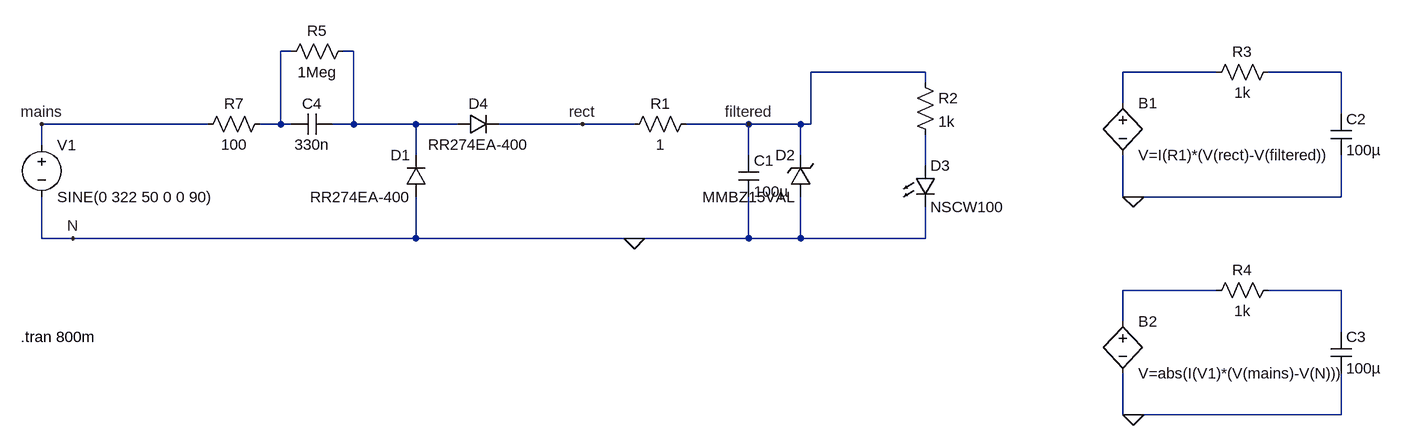
[diagram p0: schematic led_indicator_230v_capacitive.asc]
led_indicator_230v_capacitive.asc, the LTspice schematic file:
Version 4
SHEET 1 1312 680
WIRE -368 -16 -384 -16
WIRE -272 -16 -288 -16
WIRE 608 16 432 16
WIRE 1056 16 912 16
WIRE 1248 16 1136 16
WIRE 608 32 608 16
WIRE 912 64 912 16
WIRE 1248 80 1248 16
WIRE -496 96 -752 96
WIRE -384 96 -384 -16
WIRE -384 96 -416 96
WIRE -368 96 -384 96
WIRE -272 96 -272 -16
WIRE -272 96 -304 96
WIRE -176 96 -272 96
WIRE -112 96 -176 96
WIRE 80 96 -48 96
WIRE 160 96 80 96
WIRE 336 96 240 96
WIRE 416 96 336 96
WIRE 432 96 432 16
WIRE 432 96 416 96
WIRE -752 128 -752 96
WIRE -176 144 -176 96
WIRE 336 144 336 96
WIRE 416 144 416 96
WIRE 608 160 608 112
WIRE 912 208 912 144
WIRE 928 208 912 208
WIRE 1248 208 1248 144
WIRE 1248 208 928 208
WIRE -752 272 -752 208
WIRE -704 272 -752 272
WIRE -176 272 -176 208
WIRE -176 272 -704 272
WIRE 160 272 -176 272
WIRE 336 272 336 208
WIRE 336 272 160 272
WIRE 416 272 416 208
WIRE 416 272 336 272
WIRE 608 272 608 224
WIRE 608 272 416 272
WIRE 1056 352 912 352
WIRE 1248 352 1136 352
WIRE 912 400 912 352
WIRE 1248 416 1248 352
WIRE 912 544 912 480
WIRE 928 544 912 544
WIRE 1248 544 1248 480
WIRE 1248 544 928 544
FLAG 160 272 0
FLAG 928 208 0
FLAG -752 96 mains
FLAG 336 96 filtered
FLAG 928 544 0
FLAG -704 272 N
FLAG 80 96 rect
SYMBOL cap 320 144 R0
SYMATTR InstName C1
SYMATTR Value 100µ
SYMBOL LED 592 160 R0
SYMATTR InstName D3
SYMATTR Value NSCW100
SYMBOL voltage -752 112 R0
WINDOW 123 0 0 Left 2
WINDOW 39 0 0 Left 2
SYMATTR InstName V1
SYMATTR Value SINE(0 322 50 0 0 90)
SYMBOL res 592 16 R0
SYMATTR InstName R2
SYMATTR Value 1k
SYMBOL zener 432 208 R180
WINDOW 0 24 64 Left 2
WINDOW 3 24 0 Left 2
SYMATTR InstName D2
SYMATTR Value MMBZ15VAL
SYMBOL bv 912 48 R0
SYMATTR InstName B1
SYMATTR Value V=I(R1)*(V(rect)-V(filtered))
SYMBOL res 1152 0 R90
WINDOW 0 0 56 VBottom 2
WINDOW 3 32 56 VTop 2
SYMATTR InstName R3
SYMATTR Value 1k
SYMBOL cap 1232 80 R0
SYMATTR InstName C2
SYMATTR Value 100µ
SYMBOL bv 912 384 R0
SYMATTR InstName B2
SYMATTR Value V=abs(I(V1)*(V(mains)-V(N)))
SYMBOL res 1152 336 R90
WINDOW 0 0 56 VBottom 2
WINDOW 3 32 56 VTop 2
SYMATTR InstName R4
SYMATTR Value 1k
SYMBOL cap 1232 416 R0
SYMATTR InstName C3
SYMATTR Value 100µ
SYMBOL diode -112 112 R270
WINDOW 0 32 32 VTop 2
WINDOW 3 0 32 VBottom 2
SYMATTR InstName D4
SYMATTR Value RR274EA-400
SYMBOL cap -304 80 R90
WINDOW 0 0 32 VBottom 2
WINDOW 3 32 32 VTop 2
SYMATTR InstName C4
SYMATTR Value 330n
SYMBOL res -400 80 R90
WINDOW 0 0 56 VBottom 2
WINDOW 3 32 56 VTop 2
SYMATTR InstName R7
SYMATTR Value 100
SYMBOL res -272 -32 R90
WINDOW 0 0 56 VBottom 2
WINDOW 3 32 56 VTop 2
SYMATTR InstName R5
SYMATTR Value 1Meg
SYMBOL res 144 112 R270
WINDOW 0 32 56 VTop 2
WINDOW 3 0 56 VBottom 2
SYMATTR InstName R1
SYMATTR Value 1
SYMBOL diode -160 208 R180
WINDOW 0 24 64 Left 2
WINDOW 3 24 0 Left 2
SYMATTR InstName D1
SYMATTR Value RR274EA-400
TEXT -784 424 Left 2 !.tran 800m

The netlist it stands for:
* led_indicator_230v_capacitive.asc
C1 filtered 0 100µ
D3 N005 0 NSCW100
V1 mains 0 SINE(0 322 50 0 0 90)
R2 filtered N005 1k
D2 0 filtered MMBZ15VAL
B1 N003 0 V=I(R1)*(V(rect)-V(filtered))
R3 N004 N003 1k
C2 N004 0 100µ
B2 N006 0 V=abs(I(V1)*(V(mains)-V(N)))
R4 N007 N006 1k
C3 N007 0 100µ
D4 N002 rect RR274EA-400
C4 N002 N001 330n
R7 N001 mains 100
R5 N002 N001 1Meg
R1 rect filtered 1
D1 0 N002 RR274EA-400
.model D D
.lib standard.dio
.tran 800m
.backanno
.end